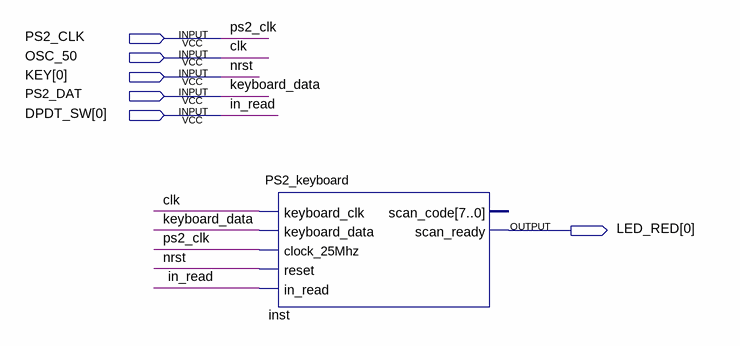
[diagram p0: schematic sheet]
// Quartus schematic keyboard_ip_test.bdf as structural Verilog: 1 symbols, 6 pins
module keyboard_ip_test (
  input  PS2_CLK,
  input  OSC_50,
  input  [0:0] KEY,
  input  PS2_DAT,
  input  [0:0] DPDT_SW,
  output [0:0] LED_RED
);

  PS2_keyboard inst (
    .keyboard_clk(OSC_50), .keyboard_data(PS2_DAT), .clock_25Mhz(PS2_CLK), .reset(KEY[0]),
    .in_read(DPDT_SW[0]), .scan_ready(LED_RED[0]));  // open: scan_code

  // Other names for the same wires on the sheet: clk = OSC_50; in_read = DPDT_SW[0]; keyboard_data = PS2_DAT;
  //   nrst = KEY[0]
endmodule
